# EAGLE design source_eagle (EAGLE 9.6.2)
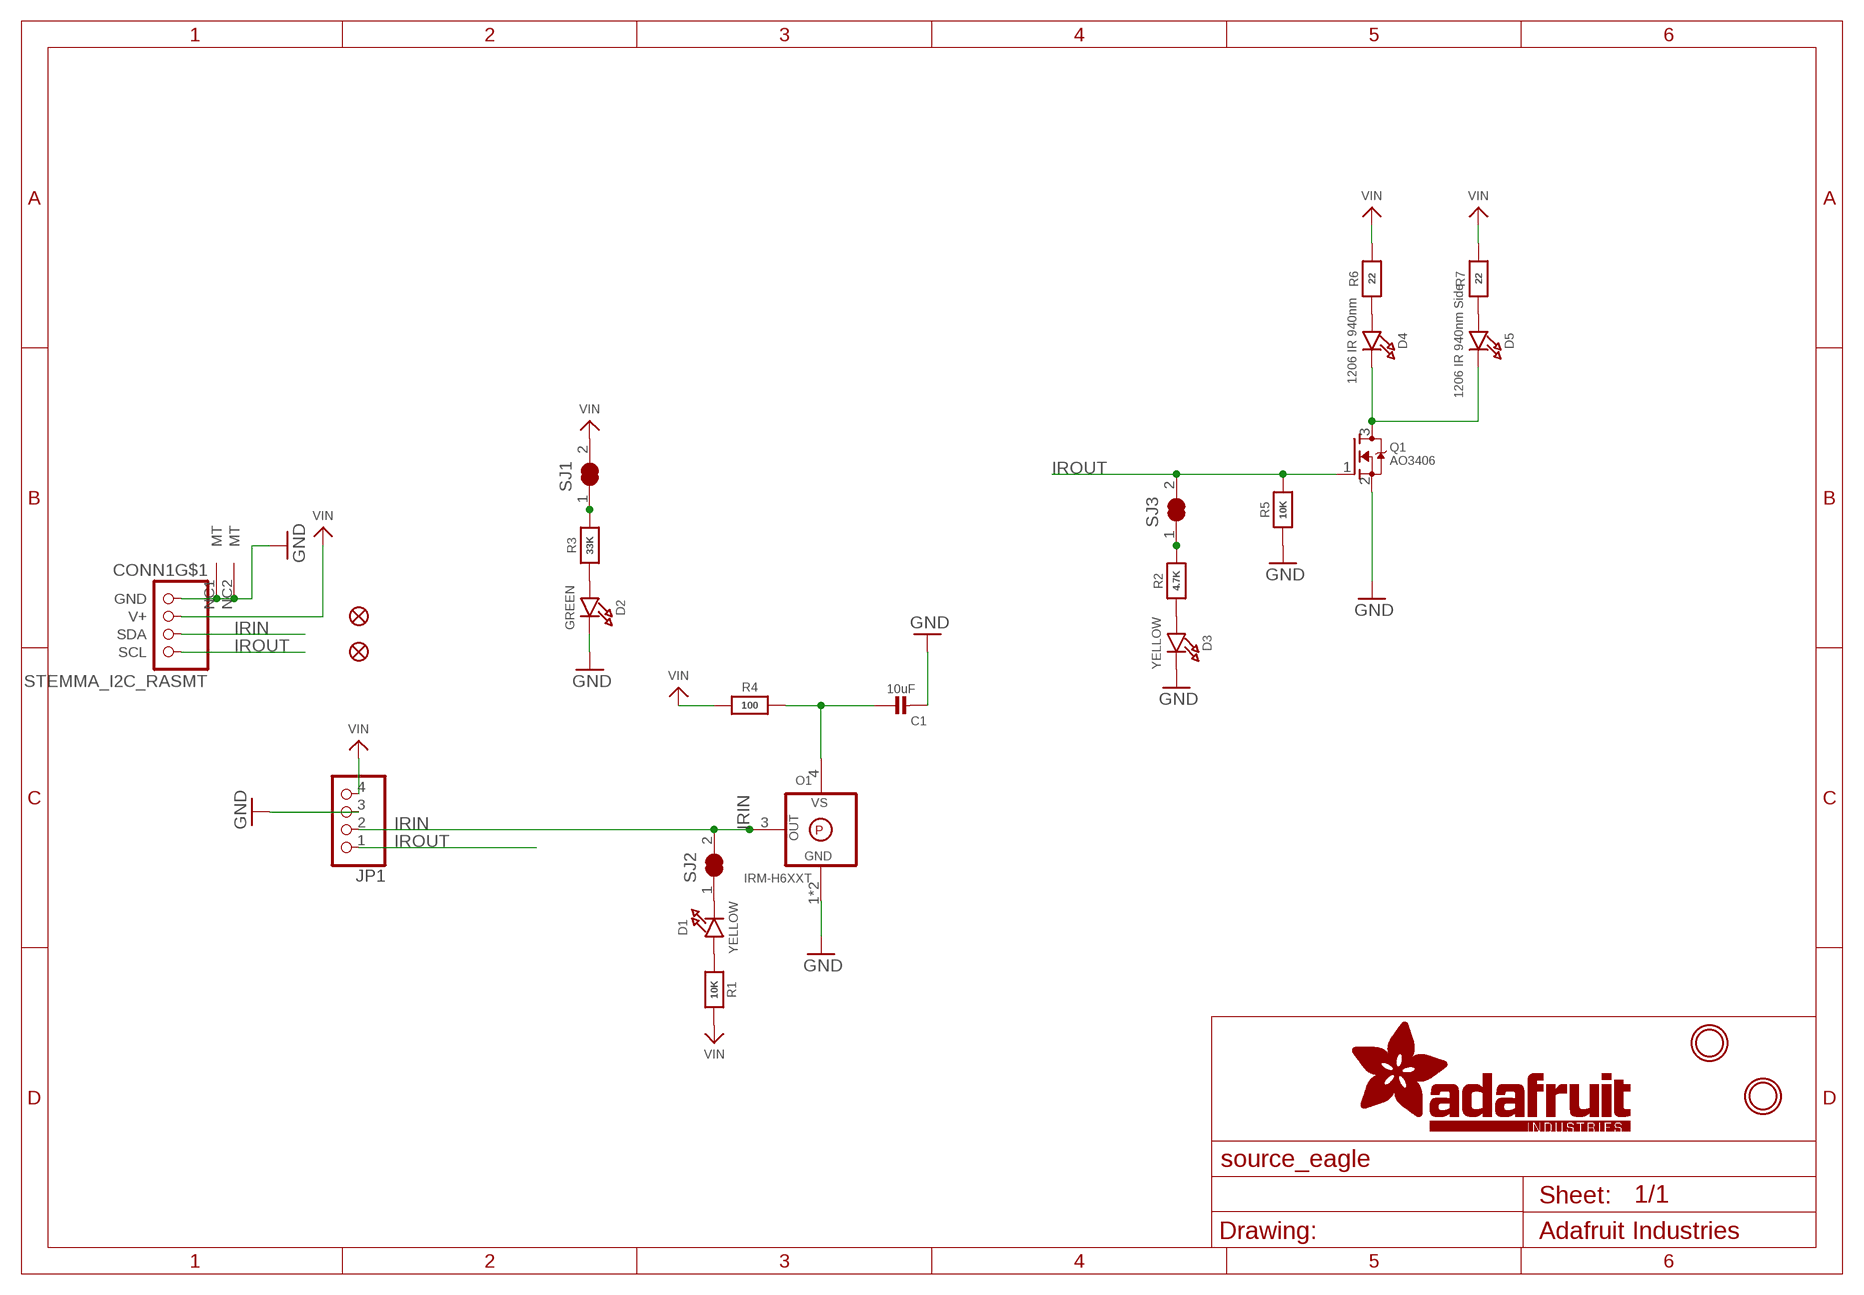
[diagram p0: schematic, sheet 1]

## Parts
C1  10uF  CAP_CERAMIC0805-NOOUTLINE  [0805-NO]
CONN1  STEMMA_I2C_RASMT  [JSTPH4]
D1  YELLOW  LED0603_NOOUTLINE  [CHIPLED_0603_NOOUTLINE]
D2  GREEN  LED0603_NOOUTLINE  [CHIPLED_0603_NOOUTLINE]
D3  YELLOW  LED0603_NOOUTLINE  [CHIPLED_0603_NOOUTLINE]
D4  1206 IR 940nm  LED1206  [CHIPLED_1206]
D5  1206 IR 940nm Side  LED_1206RA  [LED_1206_SIDE]
FID2  FIDUCIAL_1MM  [FIDUCIAL_1MM]
FID3  FIDUCIAL_1MM  [FIDUCIAL_1MM]
JP1  HEADER-1X476MIL  [1X04_ROUND_76]
O1  IRM-H6XXT  GENERIC_IR_RECV_IRM-H6XXT  [IRM-H6XXT]
Q1  AO3406  MOSFET-NWIDE  [SOT23-WIDE]
R1  10K  RESISTOR_0603_NOOUT  [0603-NO]
R2  4.7K  RESISTOR_0603_NOOUT  [0603-NO]
R3  33K  RESISTOR_0603_NOOUT  [0603-NO]
R4  100  RESISTOR_0603_NOOUT  [0603-NO]
R5  10K  RESISTOR_0603_NOOUT  [0603-NO]
R6  22  RESISTOR_0603_NOOUT  [0603-NO]
R7  22  RESISTOR_0603_NOOUT  [0603-NO]
SJ1  SOLDERJUMPER_CLOSED  [SOLDERJUMPER_CLOSEDWIRE]
SJ2  SOLDERJUMPER_CLOSED  [SOLDERJUMPER_CLOSEDWIRE]
SJ3  SOLDERJUMPER_CLOSED  [SOLDERJUMPER_CLOSEDWIRE]
U$1  MOUNTINGHOLE2.5  [MOUNTINGHOLE_2.5_PLATED]
U$8  MOUNTINGHOLE2.5  [MOUNTINGHOLE_2.5_PLATED]

## Nets
GND: C1.2 CONN1.1(GND) CONN1.NC1(MT) CONN1.NC2(MT) D2.C D3.C JP1.3 O1.1(GND) O1.2(GND) Q1.2(S) R5.1
IRIN: CONN1.3(SDA) JP1.2 O1.3(OUT) SJ2.2
IROUT: CONN1.4(SCL) JP1.1 Q1.1(G) R5.2 SJ3.2
N$1: R3.2 SJ1.1
N$2: D1.A R1.1
N$3: D1.C SJ2.1
N$4: C1.1 O1.4(VS) R4.2
N$5: R2.2 SJ3.1
N$6: D3.A R2.1
N$7: D4.C D5.C Q1.3(D)
N$8: D4.A R6.1
N$9: D5.A R7.1
N$26: D2.A R3.1
VIN: CONN1.2(V+) JP1.4 R1.2 R4.1 R6.2 R7.2 SJ1.2

## Library data of the parts
C1 = microbuilder:CAP_CERAMIC: Ceramic Capacitors For new designs, use the packages preceded by an '_' character since they are more reliable: The following footprints should be used on most boards: _0402 - Standard footprint for regular board layouts _0603 - Standard footprint for regular board layouts _0805 - Standard footprint for regular board layouts _1206 - Standard footprint for regular board layouts For extremely tight-pitch boards where space is at a premium, the following 'micro-pitch' footprints can be used (smaller pads, no silkscreen outline, etc.): _0402MP - Micro-pitch footprint for very dense/compact boards _0603MP - Micro-pitch footprint for very dense/compact boards _0805MP - Micro-pitch footprint for very dense/compact boards _1206MP - Micro-pitch footprint for very dense/compact boards
CONN1 = adafruit_electromech:STEMMA_I2C
D1-D3 = microbuilder:LED: LED 0603 - 0603 Surface Mount Package 2mA: Green LED - Low Power (3.9mcd, 2ma, 1.7Vf) - Digikey: 475-2709-2-ND Orange LED - Low Power (9.8mcd, 2ma, 1.8Vf) - Digikey: 475-1194-2-ND Red LED - Low Power (5mcd, 2ma, 1.8Vf) - Digikey: 475-1195-2-ND Yellow LED - Low Power (7mcd, 2ma, 1.8Vf) - Digikey: 475-1196-2-ND 5mA: Blue LED - Low Power (17mcd, 5ma, 2.9Vf) - Digikey: LNJ937W8CRACT-ND 0805 - 0805 Surface Mount Package 2mA: Red LED (8.8mcd, 2mA, 1.8Vf, Clear) - Low Power [Digikey: 475-2510-1-ND] Green LED (5mcd, 2mA, 1.8Vf, Clear) - Low Power [Digikey: 475-2730-1-ND] Yellow LED (11.3mcd, 2mA, 1.8Vf, Clear) - Low Power [Digikey: 475-2555-1-ND] 20mA: Red LED (104mcd, 20mA, Diffused) - LS R976 [Digikey: 475-1278-6-ND] Red LED (12mcd, 20mA, 2.0Vf, Clear) - APT2012EC [Digikey: 754-1128-1-ND] Green LED (15mcd, 20mA, 2.2Vf, Clear) - APT2012GC [Digikey: 754-1131-1-ND] Orange LED (160mcd, 20mA, 2.1Vf, Clear) - APT2012SECK [Digikey: 754-1130-1-ND] 1206 - 1206 Surface Mount Package Green LED (26mcd, 20mA, Diffused) - LG N971 [Digikey: 475-1407-6-ND] Red LED (15mcd, 20mA, Diffused) - LH N974 [Digikey: 475-1416-6-ND] Cree - Cree High-Power Surface Mount LEDs XPEBWT-L1-0000-00D50 - White 111lm 350mA 2.9Vf 6200K 110° XTEAWT-00-0000-00000LEE3 - White 114lm 350mA 2.85Vf 5000K 115° Everlight - Everlight 45-21 Series Surface Mount LEDs 45-21/QK2C-B2832AC2CB2/2T - Warm White 2000mcd 20mA 3.25Vf 3050K 120° 45-21/LK2C-B38452C4CB2/2T - Nuetral White 2000mcd 20mA 3.25Vf 4150K 120° 45-21/LK2C-B50634C6CB2/2T - Cold White 2200mcd 20mA 3.25Vf 5650K 120° PLCC2 Reverse Mount LS T77K-J1L2-1-0-2-R18-Z - Red 11.25mcd 2mA 1.8Vf 630nm 120° LO T77K-L1M2-24-Z - Orange 19.6mcd 2mA 1.8Vf 606nm 120° LY T77K-K2M1-26-Z - Yellow 15.7mcd 2mA 1.8Vf 587nm 120°; ROT: 270
D4 D5 = microbuilder:LED: LED 0603 - 0603 Surface Mount Package 2mA: Green LED - Low Power (3.9mcd, 2ma, 1.7Vf) - Digikey: 475-2709-2-ND Orange LED - Low Power (9.8mcd, 2ma, 1.8Vf) - Digikey: 475-1194-2-ND Red LED - Low Power (5mcd, 2ma, 1.8Vf) - Digikey: 475-1195-2-ND Yellow LED - Low Power (7mcd, 2ma, 1.8Vf) - Digikey: 475-1196-2-ND 5mA: Blue LED - Low Power (17mcd, 5ma, 2.9Vf) - Digikey: LNJ937W8CRACT-ND 0805 - 0805 Surface Mount Package 2mA: Red LED (8.8mcd, 2mA, 1.8Vf, Clear) - Low Power [Digikey: 475-2510-1-ND] Green LED (5mcd, 2mA, 1.8Vf, Clear) - Low Power [Digikey: 475-2730-1-ND] Yellow LED (11.3mcd, 2mA, 1.8Vf, Clear) - Low Power [Digikey: 475-2555-1-ND] 20mA: Red LED (104mcd, 20mA, Diffused) - LS R976 [Digikey: 475-1278-6-ND] Red LED (12mcd, 20mA, 2.0Vf, Clear) - APT2012EC [Digikey: 754-1128-1-ND] Green LED (15mcd, 20mA, 2.2Vf, Clear) - APT2012GC [Digikey: 754-1131-1-ND] Orange LED (160mcd, 20mA, 2.1Vf, Clear) - APT2012SECK [Digikey: 754-1130-1-ND] 1206 - 1206 Surface Mount Package Green LED (26mcd, 20mA, Diffused) - LG N971 [Digikey: 475-1407-6-ND] Red LED (15mcd, 20mA, Diffused) - LH N974 [Digikey: 475-1416-6-ND] Cree - Cree High-Power Surface Mount LEDs XPEBWT-L1-0000-00D50 - White 111lm 350mA 2.9Vf 6200K 110° XTEAWT-00-0000-00000LEE3 - White 114lm 350mA 2.85Vf 5000K 115° Everlight - Everlight 45-21 Series Surface Mount LEDs 45-21/QK2C-B2832AC2CB2/2T - Warm White 2000mcd 20mA 3.25Vf 3050K 120° 45-21/LK2C-B38452C4CB2/2T - Nuetral White 2000mcd 20mA 3.25Vf 4150K 120° 45-21/LK2C-B50634C6CB2/2T - Cold White 2200mcd 20mA 3.25Vf 5650K 120° PLCC2 Reverse Mount LS T77K-J1L2-1-0-2-R18-Z - Red 11.25mcd 2mA 1.8Vf 630nm 120° LO T77K-L1M2-24-Z - Orange 19.6mcd 2mA 1.8Vf 606nm 120° LY T77K-K2M1-26-Z - Yellow 15.7mcd 2mA 1.8Vf 587nm 120°
FID2 FID3 = microbuilder:FIDUCIAL: Fiducial Alignment Points Various fiducial points for machine vision alignment.; BOM: EXCLUDE
JP1 = microbuilder:HEADER-1X4: PIN HEADER
O1 = adafruit_sensor:GENERIC_IR_RECV
Q1 = microbuilder:MOSFET-N: N-Channel Mosfet LEGEND VDS: Voltage Drain-Source ID: Drain Current RDS(ON): Drain-Source On-State Resistance VGS(TH): Gate-Source Threshold Voltage CISS: Drain-Source Input Capacitance SOT-23 Name VDS ID RDS(ON) VGS(TH) CISS Order Number 2N7002E 60V 260mA 2.5 Ohm 2.5V @ 250uA 26.7pF @ 25V 2N7002ET1GOSTR-ND BSH103 30V 850mA 400 mOhm 400mV @ 1mA 83pF @ 24V BSH103,235-ND BSS138 60V 320mA 1.6 Ohm 1.5V @ 250uA 50pF @ 10V Mouser: 771-BSS138PW115 DMN2075U-7 20V 4.2A 38 mOhm 1V @ 250 uA 594.3pF @ 10V DMN2075U-7DICT-ND * BSS138 good choice for I2C level-shifting POWERPAK 1212-8 Name VDS ID RDS(ON) VGS(TH) CISS Order Number Si7308DN 60V 6A 58 mOhm 3V @ 250uA 665pF @ 15V SI7308DN-T1-E3CT-ND
R1-R7 = microbuilder:RESISTOR: Resistors For new designs, use the packages preceded by an '_' character since they are more reliable: The following footprints should be used on most boards: _0402 - Standard footprint for regular board layouts _0603 - Standard footprint for regular board layouts _0805 - Standard footprint for regular board layouts _1206 - Standard footprint for regular board layouts For extremely tight-pitch boards where space is at a premium, the following 'micro-pitch' footprints can be used (smaller pads, no silkscreen outline, etc.): _0402MP - Micro-pitch footprint for very dense/compact boards _0603MP - Micro-pitch footprint for very dense/compact boards _0805MP - Micro-pitch footprint for very dense/compact boards _1206MP - Micro-pitch footprint for very dense/compact boards
SJ1-SJ3 = microbuilder:SOLDERJUMPER_CLOSED: Solder Jumper - Closed These solder jumpers are closed by default CLOSEDWIRE - 10 mil trace between pads that can be cut and resoldered later CLOSEDPERM - 63 mil trace between pads for a permanent connection (used to 'bridge' two signals, a shameless hack for Eagle). Can double as a test point as well (no cream layer)
U$1 U$8 = adafruit_electromech:MOUNTINGHOLE: Mounting Hole For #2 screws (0.086"/2.18mm width, 0.094"/2.4mm hole) use 2.5mm; BOM: EXCLUDE

## Net classes
1 HV: width 0.406 mm, drill 0.381 mm, clearance 0.762 mm

## Board
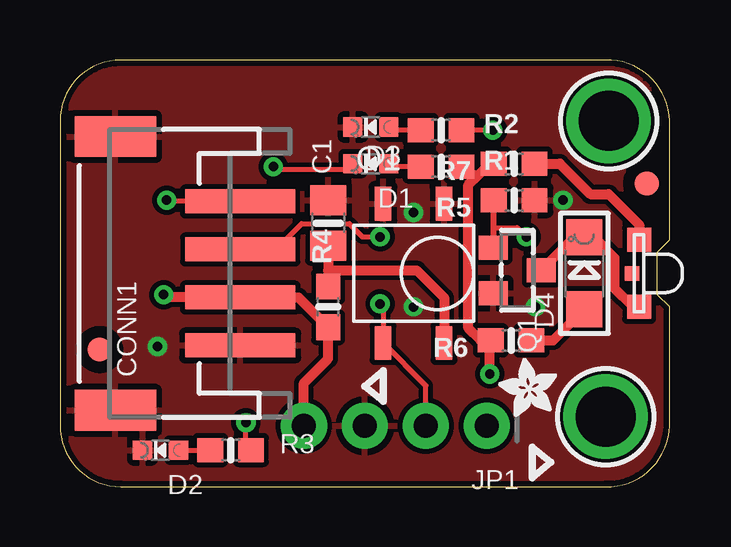
[diagram p1: board, top side]
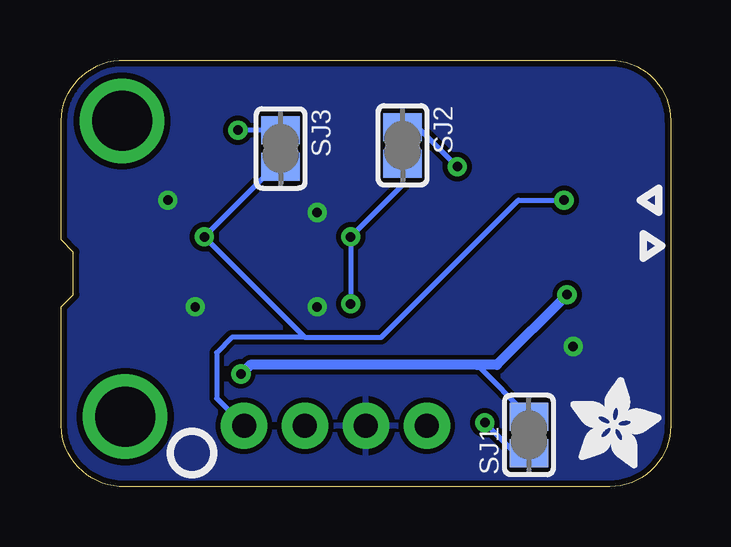
[diagram p2: board, bottom side, seen from below]

Size 25.4 x 17.78 mm. Coordinates in mm from the lower left corner, seen from the top.
Outline: 0,15.24 0,2.54 arc90 2.54,0 22.73,0 arc90 25.4,2.54 25.4,7.49 24.89,8 24.89,9.78 25.4,10.29 25.4,15.24 arc90 22.73,17.78 2.54,17.78 arc90 0,15.24
Copper layers (1*16): Top 0.035mm / dielectric 1.5mm / Bottom 0.035mm
Design rules "adafruit": minimum track width 8mil, minimum drill 15.5mil, track to track 8mil, track to pad 8mil, pad to pad 8mil, via to via 8mil, smd to smd 8mil, copper to edge 10mil, drill to drill 8mil, minimum pad ring 10mil, minimum via ring 8mil, stop-mask expansion 2mil, vias tented up to drill 20mil, thermal gap 10mil

### Footprints (pad centres in the part's own frame; a part is rotated, then mirrored left to right if it is on the bottom)
0805-NO = smd 1.24 x 1.5: 1 -0.95,0; 2 0.95,0
JSTPH4 = smd 1 x 4.6: 1 -3,-2.43; 2 -1,-2.43; 3 1,-2.43; 4 3,-2.43 | smd 1.7 x 3.4: NC1 -5.7,2.77; NC2 5.7,2.77
CHIPLED_0603_NOOUTLINE = smd 0.8 x 0.8: A 0,-0.75; C 0,0.75
CHIPLED_1206 = smd 1.5 x 1.5: A 0,-1.496; C 0,1.496
LED_1206_SIDE = smd 1 x 1: A 1.4,0; C -1.4,0 | smd 0.6 x 0.6: MT 0,0.3
FIDUCIAL_1MM = smd 1 x 1: 1 0,0
1X04_ROUND_76 = drill 1 pad 1.93: 1 -3.81,0; 2 -1.27,0; 3 1.27,0; 4 3.81,0
IRM-H6XXT = smd 0.7 x 1.4: 1 1.27,2.9; 2 -1.27,2.9; 3 -1.27,-2.9; 4 1.27,-2.9
SOT23-WIDE = smd 1 x 1.2: 1 -0.95,-1; 2 0.95,-1; 3 0,1
0603-NO = smd 1.075 x 1: 1 -0.85,0; 2 0.85,0
SOLDERJUMPER_CLOSEDWIRE = smd 1.168 x 1.6: 1 -0.762,0; 2 0.762,0 | smd 0.635 x 0.203: WIRE 0,0
MOUNTINGHOLE_2.5_PLATED = drill 2.5 pad 3.2: P$1 0,0

### Placement (x,y rotation side)
C1  11.18,10.99 90 top
CONN1  5.08,8.89 90 top
D1  12.95,13.46 90 top
D2  4.19,1.52 90 top
D3  12.95,14.99 90 top
D4  21.84,8.89 0 top
D5  24.13,8.89 90 top
FID2  1.65,5.71 0 top
FID3  24.45,12.64 0 top
JP1  13.97,2.54 180 top
O1  14.73,8.89 0 top
PLABEL0  [PLABEL0]  10.03,12.95 0 top
PLABEL1  [PLABEL1]  8.51,14.48 0 top
PLABEL2  [PLABEL2]  9.02,3.68 0 top
PLABEL3  [PLABEL3]  11.3,0.25 0 top
PLABEL4  [PLABEL4]  13.84,3.68 0 top
PLABEL5  [PLABEL5]  15.88,0.51 0 top
PLABEL6  [PLABEL6]  0.51,1.02 0 top
PLABEL7  [PLABEL7]  1.14,15.88 0 top
PLABEL8  [PLABEL8]  8.76,13.97 90 bottom
PLABEL9  [PLABEL9]  13.97,12.57 90 bottom
PLABEL10  [PLABEL10]  7.24,0.76 90 bottom
PLABEL11  [PLABEL11]  24.77,4.95 0 bottom
PLABEL12  [PLABEL12]  3.68,11.3 0 bottom
PLABEL13  [PLABEL13]  5.59,9.4 0 bottom
PLABEL14  [PLABEL14]  2.92,7.37 0 bottom
PLABEL15  [PLABEL15]  4.45,5.33 0 bottom
PLABEL16  [PLABEL16]  0.38,13.08 90 bottom
PLABEL17  [PLABEL17]  20.83,16.26 0 bottom
Q1  19.05,9.02 270 top
R1  15.88,13.34 0 top
R2  15.88,14.86 0 top
R3  7.11,1.52 0 top
R4  11.18,7.49 90 top
R5  18.92,11.94 180 top
R6  18.8,6.1 180 top
R7  18.92,13.46 180 top
SJ1  5.91,2.16 90 bottom
SJ2  11.18,14.22 270 bottom
SJ3  16.26,14.1 270 bottom
U$1  22.73,2.92 0 top
U$5  [PCBFEAT-REV-040]  19.94,1.4 0 bottom
U$8  22.86,15.24 0 top
U$12  [ADAFRUIT_3.5MM]  4.19,0.76 0 bottom
U$13  [ADAFRUIT_2.5MM]  20.7,2.92 90 top

### Tracks (layer width: path | path; a pad name or v marks a point on that pad's centre or on a via)
GND  (via drill 0.39)
  other vias: 14.73,11.43 20.95,11.94 19.81,7.49 14.73,7.49 4.06,5.84
  pour Top: 0,17.78 25.4,17.78 25.4,0 0,0
  pour Bottom: 0,17.78 25.4,17.78 25.4,0 0,0
IRIN  (via drill 0.39)
  Top 0.203: v13.34,7.62 13.46,7.49 O1.3 15.24,4.21 JP1.2 | CONN1.3 9,9.89 10.07,10.96 12.05,10.96 12.6,10.41 v13.34,10.41
  Bottom 0.203: v13.34,7.62 v13.34,10.41 11.18,12.57 SJ2.2
IROUT  (via drill 0.39)
  Top 0.203: CONN1.4 4.49,11.89 v4.45,11.94 | 18.07,10.79 19.05,10.79 v19.43,10.41
  Top 0.254: Q1.1 18.07,9.99 18.07,10.79 R5.2
  Bottom 0.203: 15.24,6.22 v19.43,10.41 16.51,13.34 SJ3.2 | 15.24,6.22 12.06,6.22 6.35,11.94 v4.45,11.94 | 15.24,6.22 18.29,6.22 18.92,5.59 18.92,3.68 JP1.1
N$1  (via drill 0.39)
  Top 0.203: R3.2 7.75,1.74 v7.75,2.67
  Bottom 0.203: v7.75,2.67 6.48,1.4 SJ1.1
N$2
  Top 0.203: R1.1 13.83,13.34 D1.A
N$3  (via drill 0.39)
  Top 0.203: v8.89,13.34 8.89,13.21 11.95,13.21 D1.C
  Bottom 0.203: SJ2.1 10.54,14.99 v8.89,13.34
N$4
  Top 0.406: C1.1 11.18,9.02 | 11.18,9.02 R4.2 | 11.18,9.02 14.86,9.02 16,7.87 O1.4
N$5  (via drill 0.39)
  Top 0.203: v18.03,14.86 R2.2
  Bottom 0.203: SJ3.1 v18.03,14.86
N$6
  Top 0.203: R2.1 13.83,14.86 D3.A
N$7
  Top 0.406: Q1.3 21.42,10.39 D4.C 22.25,10.39 23.11,9.53 23.11,8.26 23.88,7.49 D5.C
N$8
  Top 0.406: R6.1 20.55,6.1 D4.A
N$9
  Top 0.406: R7.1 20.83,13.46 22.1,12.19 22.86,12.19 24.13,10.92 D5.A
N$26
  Top 0.203: D2.A R3.1
VIN  (via drill 0.39)
  Top 0.203: R1.2 17.02,13.34 17.4,12.95
  Top 0.406: JP1.4 10.16,4.32 11.18,5.33 R4.1 9.93,7.89 CONN1.2 4.43,7.89 v4.32,8 | R6.2 17.91,6.1 | 17.91,6.1 17.53,6.1 17.02,6.6 17.02,12.57 17.4,12.95 17.91,13.46 R7.2 | v17.91,4.7 17.91,6.1
  Bottom 0.203: SJ1.2 8.06,5.08
  Bottom 0.406: v4.32,8 7.24,5.08 8.06,5.08 17.53,5.08 v17.91,4.7

### Text on the board
Pinguin_tBackup: 38KHz IR Transceiver | V | H | ON | Signal High / To Send | OUT | IN | VIN | IRin | 38KHz IR Recv | 940nm Infrared / LED Emitters | Sig | ON | IRout | GND
Pinguin_bBackup: Logic/Power: 3~5VDC | V+:3~5VDC | OUT | Vin/Vlogic: 3~5VDC | IN | 100mA+ Current/LED | JST / PH | LED | IN | In | On | 38KHz / Infrared / Remote / Decoding / Receiver | V+ | OUT | Vin | SIG | GND | Sig | 38KHz 940nm IR / Remote Receiver / & LED Transmitters | GND | Optional / 5mm LED | Sig | IRV | IRH | In | V+ | GND | ON